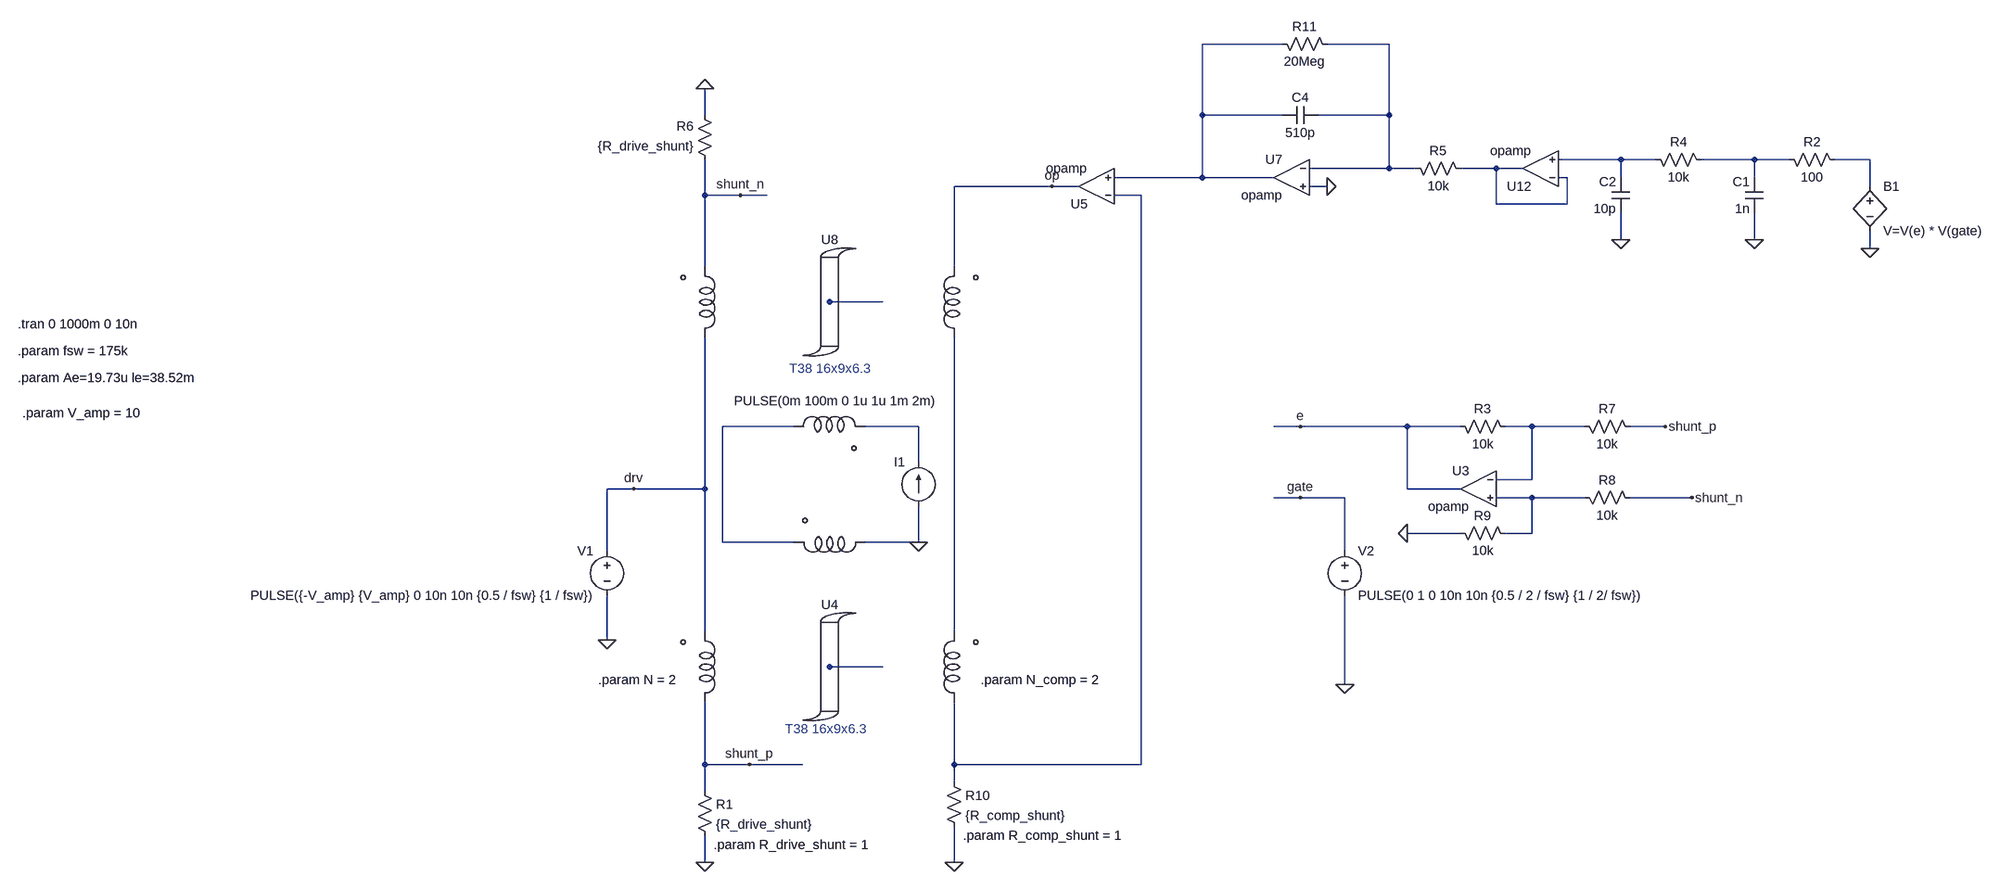
[diagram p0: schematic basic_closed_loop_example_BW_cc_2.asc]
basic_closed_loop_example_BW_cc_2.asc, the LTspice schematic file:
Version 4
SHEET 1 3936 1332
WIRE 224 -2928 80 -2928
WIRE 416 -2928 304 -2928
WIRE -816 -2800 -816 -2848
WIRE 80 -2800 80 -2928
WIRE 224 -2800 80 -2800
WIRE 416 -2800 416 -2928
WIRE 416 -2800 288 -2800
WIRE 832 -2720 720 -2720
WIRE 896 -2720 832 -2720
WIRE 1072 -2720 976 -2720
WIRE 1136 -2720 1072 -2720
WIRE 1280 -2720 1216 -2720
WIRE 416 -2704 416 -2800
WIRE 416 -2704 272 -2704
WIRE 464 -2704 416 -2704
WIRE 608 -2704 544 -2704
WIRE 656 -2704 608 -2704
WIRE 80 -2688 80 -2800
WIRE 80 -2688 -80 -2688
WIRE 208 -2688 80 -2688
WIRE 736 -2688 720 -2688
WIRE 832 -2688 832 -2720
WIRE 1072 -2688 1072 -2720
WIRE -192 -2672 -368 -2672
WIRE -144 -2672 -192 -2672
WIRE 304 -2672 272 -2672
WIRE 1280 -2672 1280 -2720
WIRE -816 -2656 -816 -2720
WIRE -752 -2656 -816 -2656
WIRE -704 -2656 -752 -2656
WIRE -32 -2656 -80 -2656
WIRE 608 -2640 608 -2704
WIRE 736 -2640 736 -2688
WIRE 736 -2640 608 -2640
WIRE 832 -2576 832 -2624
WIRE 1072 -2576 1072 -2624
WIRE 1280 -2560 1280 -2592
WIRE -816 -2528 -816 -2656
WIRE -368 -2528 -368 -2672
WIRE -496 -2464 -592 -2464
WIRE -656 -2240 -784 -2240
WIRE -432 -2240 -528 -2240
WIRE 256 -2240 208 -2240
WIRE 448 -2240 256 -2240
WIRE 544 -2240 448 -2240
WIRE 672 -2240 624 -2240
WIRE 768 -2240 672 -2240
WIRE 912 -2240 848 -2240
WIRE -432 -2176 -432 -2240
WIRE 672 -2144 672 -2240
WIRE 672 -2144 608 -2144
WIRE -944 -2128 -992 -2128
WIRE -816 -2128 -816 -2400
WIRE -816 -2128 -944 -2128
WIRE 448 -2128 448 -2240
WIRE 544 -2128 448 -2128
WIRE 256 -2112 208 -2112
WIRE 336 -2112 256 -2112
WIRE 672 -2112 608 -2112
WIRE 768 -2112 672 -2112
WIRE 960 -2112 848 -2112
WIRE 544 -2048 448 -2048
WIRE 672 -2048 672 -2112
WIRE 672 -2048 624 -2048
WIRE -784 -2032 -784 -2240
WIRE -656 -2032 -784 -2032
WIRE -432 -2032 -432 -2096
WIRE -432 -2032 -528 -2032
WIRE -992 -2016 -992 -2128
WIRE 336 -2016 336 -2112
WIRE -816 -1872 -816 -2128
WIRE -368 -1872 -368 -2400
WIRE -992 -1856 -992 -1936
WIRE -496 -1808 -592 -1808
WIRE 336 -1776 336 -1936
WIRE -816 -1632 -816 -1744
WIRE -736 -1632 -816 -1632
WIRE -640 -1632 -736 -1632
WIRE -368 -1632 -368 -1744
WIRE -32 -1632 -32 -2656
WIRE -32 -1632 -368 -1632
WIRE -368 -1600 -368 -1632
WIRE -816 -1584 -816 -1632
WIRE -816 -1456 -816 -1504
WIRE -368 -1456 -368 -1520
FLAG -992 -1856 0
FLAG 336 -1776 0
FLAG -944 -2128 drv
FLAG -816 -2848 0
FLAG 448 -2048 0
FLAG -736 -1632 shunt_p
FLAG 912 -2240 shunt_p
FLAG 960 -2112 shunt_n
FLAG -752 -2656 shunt_n
FLAG -368 -1456 0
FLAG -816 -1456 0
FLAG 256 -2112 gate
FLAG 256 -2240 e
FLAG 1280 -2560 0
FLAG -432 -2032 0
FLAG 304 -2672 0
FLAG -192 -2672 op
FLAG 1072 -2576 0
FLAG 832 -2576 0
SYMBOL voltage -992 -2032 M0
WINDOW 123 0 0 Left 0
WINDOW 39 0 0 Left 0
SYMATTR InstName V1
SYMATTR Value PULSE({-V_amp} {V_amp} 0 10n 10n {0.5 / fsw} {1 / fsw})
SYMBOL Winding -816 -1808 R0
WINDOW 0 -93 39 Invisible 2
WINDOW 39 -225 76 Invisible 2
WINDOW 3 -98 42 Invisible 2
SYMATTR InstName U1
SYMATTR SpiceLine n={N} L=10n Rs=1m Rp=100Meg
SYMBOL Core_Chan -592 -1808 R0
WINDOW 3 41 88 Invisible 2
WINDOW 39 13 112 Invisible 2
WINDOW 0 1 -96 Bottom 2
SYMATTR SpiceLine Bs=0.43 Br=0.1 Hc=8
SYMATTR InstName U4
SYMATTR SpiceLine2 A={Ae} Lm={le} Lg=0 Rp=1Meg
SYMBOL res -832 -1600 R0
SYMATTR InstName R1
SYMATTR Value {R_drive_shunt}
SYMBOL Winding -592 -2032 M90
WINDOW 0 -93 39 Invisible 2
WINDOW 39 -196 73 Invisible 2
WINDOW 3 -98 42 Invisible 2
SYMATTR InstName U2
SYMATTR SpiceLine n={1} L=10n Rs=1m Rp=100k
SYMBOL current -432 -2096 R180
WINDOW 0 24 80 Left 2
WINDOW 3 149 190 Center 2
WINDOW 123 0 0 Left 0
WINDOW 39 0 0 Left 0
SYMATTR InstName I1
SYMATTR Value PULSE(0m 100m 0 1u 1u 1m 2m)
SYMBOL voltage 336 -2032 R0
WINDOW 123 0 0 Left 0
WINDOW 39 0 0 Left 0
SYMATTR InstName V2
SYMATTR Value PULSE(0 1 0 10n 10n {0.5 / 2 / fsw} {1 / 2/ fsw})
SYMBOL opamp 240 -2752 M0
SYMATTR InstName U7
SYMATTR SpiceLine2 GBW=1000Meg
SYMBOL Winding -816 -2464 R0
WINDOW 0 221 26 Invisible 2
WINDOW 39 259 -62 Invisible 2
WINDOW 3 214 -32 Invisible 2
SYMATTR InstName U6
SYMATTR SpiceLine n={N} L=10n Rs=1m Rp=100Meg
SYMBOL Core_Chan -592 -2464 R0
WINDOW 3 41 88 Invisible 2
WINDOW 39 13 112 Invisible 2
WINDOW 0 1 -96 Bottom 2
SYMATTR SpiceLine Bs=0.43 Br=0.1 Hc=8
SYMATTR InstName U8
SYMATTR SpiceLine2 A={Ae} Lm={le} Lg=0 Rp=1Meg
SYMBOL res -800 -2704 R180
WINDOW 0 36 76 Left 2
WINDOW 3 36 40 Left 2
SYMATTR InstName R6
SYMATTR Value {R_drive_shunt}
SYMBOL Winding -592 -2240 M270
WINDOW 0 -93 39 Invisible 2
WINDOW 39 -196 73 Invisible 2
WINDOW 3 -98 42 Invisible 2
SYMATTR InstName U9
SYMATTR SpiceLine n={1} L=10n Rs=1m Rp=100k
SYMBOL opamp 576 -2192 M0
SYMATTR InstName U3
SYMATTR SpiceLine2 GBW=100Meg
SYMBOL res 528 -2256 M90
WINDOW 0 0 56 VBottom 2
WINDOW 3 32 56 VTop 2
SYMATTR InstName R3
SYMATTR Value 10k
SYMBOL res 752 -2256 M90
WINDOW 0 0 56 VBottom 2
WINDOW 3 32 56 VTop 2
SYMATTR InstName R7
SYMATTR Value 10k
SYMBOL res 752 -2128 M90
WINDOW 0 0 56 VBottom 2
WINDOW 3 32 56 VTop 2
SYMATTR InstName R8
SYMATTR Value 10k
SYMBOL res 528 -2064 M90
WINDOW 0 0 56 VBottom 2
WINDOW 3 32 56 VTop 2
SYMATTR InstName R9
SYMATTR Value 10k
SYMBOL Winding -368 -1808 M0
WINDOW 0 -93 39 Invisible 2
WINDOW 39 -225 76 Invisible 2
WINDOW 3 -98 42 Invisible 2
SYMATTR InstName U10
SYMATTR SpiceLine n={N_comp} L=10n Rs=1m Rp=100Meg
SYMBOL Winding -368 -2464 M0
WINDOW 0 221 26 Invisible 2
WINDOW 39 259 -62 Invisible 2
WINDOW 3 214 -32 Invisible 2
SYMATTR InstName U11
SYMATTR SpiceLine n={N_comp} L=10n Rs=1m Rp=100Meg
SYMBOL res -384 -1616 R0
SYMATTR InstName R10
SYMATTR Value {R_comp_shunt}
SYMBOL bv 1280 -2688 R0
SYMATTR InstName B1
SYMATTR Value V=V(e) * V(gate)
SYMBOL res 448 -2720 M90
WINDOW 0 0 56 VBottom 2
WINDOW 3 32 56 VTop 2
SYMATTR InstName R5
SYMATTR Value 10k
SYMBOL cap 288 -2816 R90
WINDOW 0 0 32 VBottom 2
WINDOW 3 32 32 VTop 2
SYMATTR InstName C4
SYMATTR Value 510p
SYMBOL res 1120 -2736 M90
WINDOW 0 0 56 VBottom 2
WINDOW 3 32 56 VTop 2
SYMATTR InstName R2
SYMATTR Value 100
SYMBOL cap 1088 -2624 R180
WINDOW 0 24 56 Left 2
WINDOW 3 24 8 Left 2
SYMATTR InstName C1
SYMATTR Value 1n
SYMBOL res 208 -2944 M90
WINDOW 0 0 56 VBottom 2
WINDOW 3 32 56 VTop 2
SYMATTR InstName R11
SYMATTR Value 20Meg
SYMBOL opamp -112 -2608 R180
SYMATTR InstName U5
SYMATTR SpiceLine2 GBW=1000Meg
SYMBOL res 880 -2736 M90
WINDOW 0 0 56 VBottom 2
WINDOW 3 32 56 VTop 2
SYMATTR InstName R4
SYMATTR Value 10k
SYMBOL cap 848 -2624 R180
WINDOW 0 24 56 Left 2
WINDOW 3 24 8 Left 2
SYMATTR InstName C2
SYMATTR Value 10p
SYMBOL opamp 688 -2640 R180
SYMATTR InstName U12
SYMATTR SpiceLine2 GBW=1000Meg
TEXT -2856 -2424 Left 2 !.tran 0 1000m 0 10n
TEXT -2856 -2328 Left 2 !.param Ae=19.73u le=38.52m
TEXT -2856 -2376 Left 2 !.param fsw = 175k
TEXT -2848 -2264 Left 2 !.param V_amp = 10
TEXT -672 -1696 Left 2 ;T38 16x9x6.3
TEXT -320 -1784 Left 2 !.param N_comp = 2
TEXT -664 -2344 Left 2 ;T38 16x9x6.3
TEXT -1008 -1784 Left 2 !.param N = 2
TEXT -800 -1488 Left 2 !.param R_drive_shunt = 1
TEXT -352 -1504 Left 2 !.param R_comp_shunt = 1

The netlist it stands for:
* basic_closed_loop_example_BW_cc_2.asc
V1 drv 0 PULSE({-V_amp} {V_amp} 0 10n 10n {0.5 / fsw} {1 / fsw})
XU1 shunt_p drv N014 Winding n={N} L=10n Rs=1m Rp=100Meg  ; pins s f c
XU4 N014 Core_Chan Bs=0.43 Br=0.1 Hc=8 A={Ae} Lm={le} Lg=0 Rp=1Meg  ; pins C
R1 shunt_p 0 {R_drive_shunt}
XU2 0 N009 N014 Winding n={1} L=10n Rs=1m Rp=100k  ; pins s f c
I1 0 N010 PULSE(0m 100m 0 1u 1u 1m 2m)
V2 gate 0 PULSE(0 1 0 10n 10n {0.5 / 2 / fsw} {1 / 2/ fsw})
XU7 N002 0 N001 opamp Aol=100K GBW=1000Meg  ; pins invin noninvin out
XU6 drv shunt_n N008 Winding n={N} L=10n Rs=1m Rp=100Meg  ; pins s f c
XU8 N008 Core_Chan Bs=0.43 Br=0.1 Hc=8 A={Ae} Lm={le} Lg=0 Rp=1Meg  ; pins C
R6 shunt_n 0 {R_drive_shunt}
XU9 N009 N010 N008 Winding n={1} L=10n Rs=1m Rp=100k  ; pins s f c
XU3 N011 N012 e opamp Aol=100K GBW=100Meg  ; pins invin noninvin out
R3 e N011 10k
R7 N011 shunt_p 10k
R8 N012 shunt_n 10k
R9 0 N012 10k
XU10 N007 N013 N014 Winding n={N_comp} L=10n Rs=1m Rp=100Meg  ; pins s f c
XU11 N013 op N008 Winding n={N_comp} L=10n Rs=1m Rp=100Meg  ; pins s f c
R10 N007 0 {R_comp_shunt}
B1 N005 0 V=V(e) * V(gate)
R5 N002 N006 10k
C4 N002 N001 510p
R2 N004 N005 100
C1 0 N004 1n
R11 N001 N002 20Meg
XU5 N007 N001 op opamp Aol=100K GBW=1000Meg  ; pins invin noninvin out
R4 N003 N004 10k
C2 0 N003 10p
XU12 N006 N003 N006 opamp Aol=100K GBW=1000Meg  ; pins invin noninvin out
.tran 0 1000m 0 10n
.param Ae=19.73u le=38.52m
.param fsw = 175k
.param V_amp = 10
* T38 16x9x6.3
.param N_comp = 2
* T38 16x9x6.3
.param N = 2
.param R_drive_shunt = 1
.param R_comp_shunt = 1
.lib Winding.lib
.lib Core_Chan.lib
.backanno
.end